# EAGLE board Adafruit Metro ESP32-P4 Hydra rev A (EAGLE 9.6.2)
REV: A
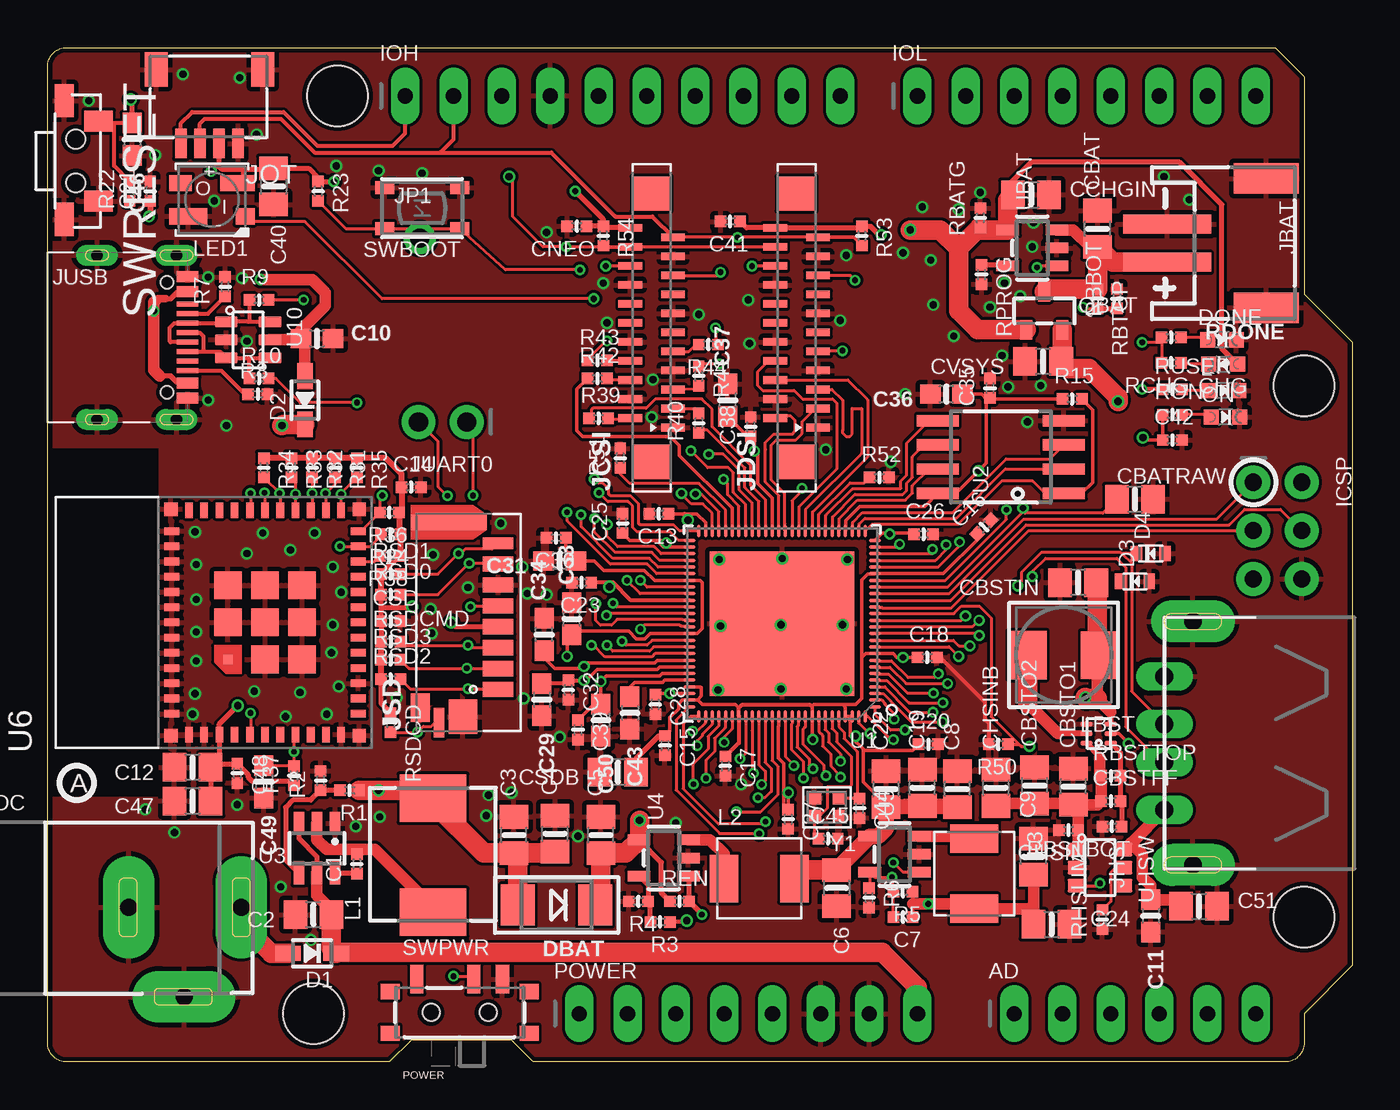
[diagram p3: board, top side]
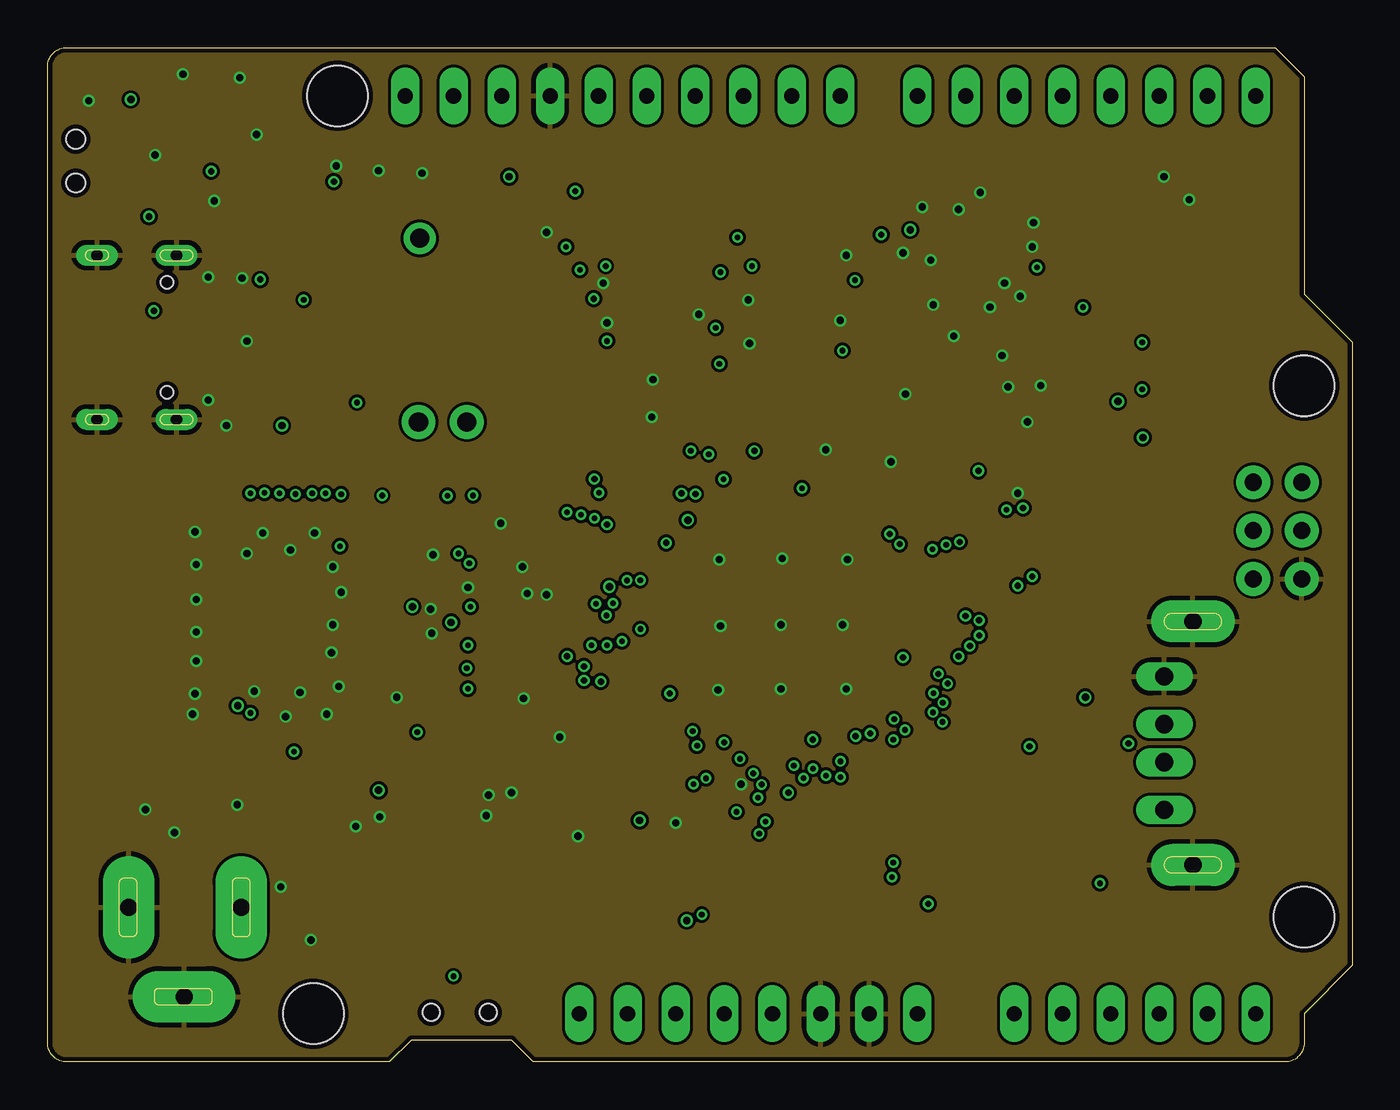
[diagram p4: board, inner layer Route2]
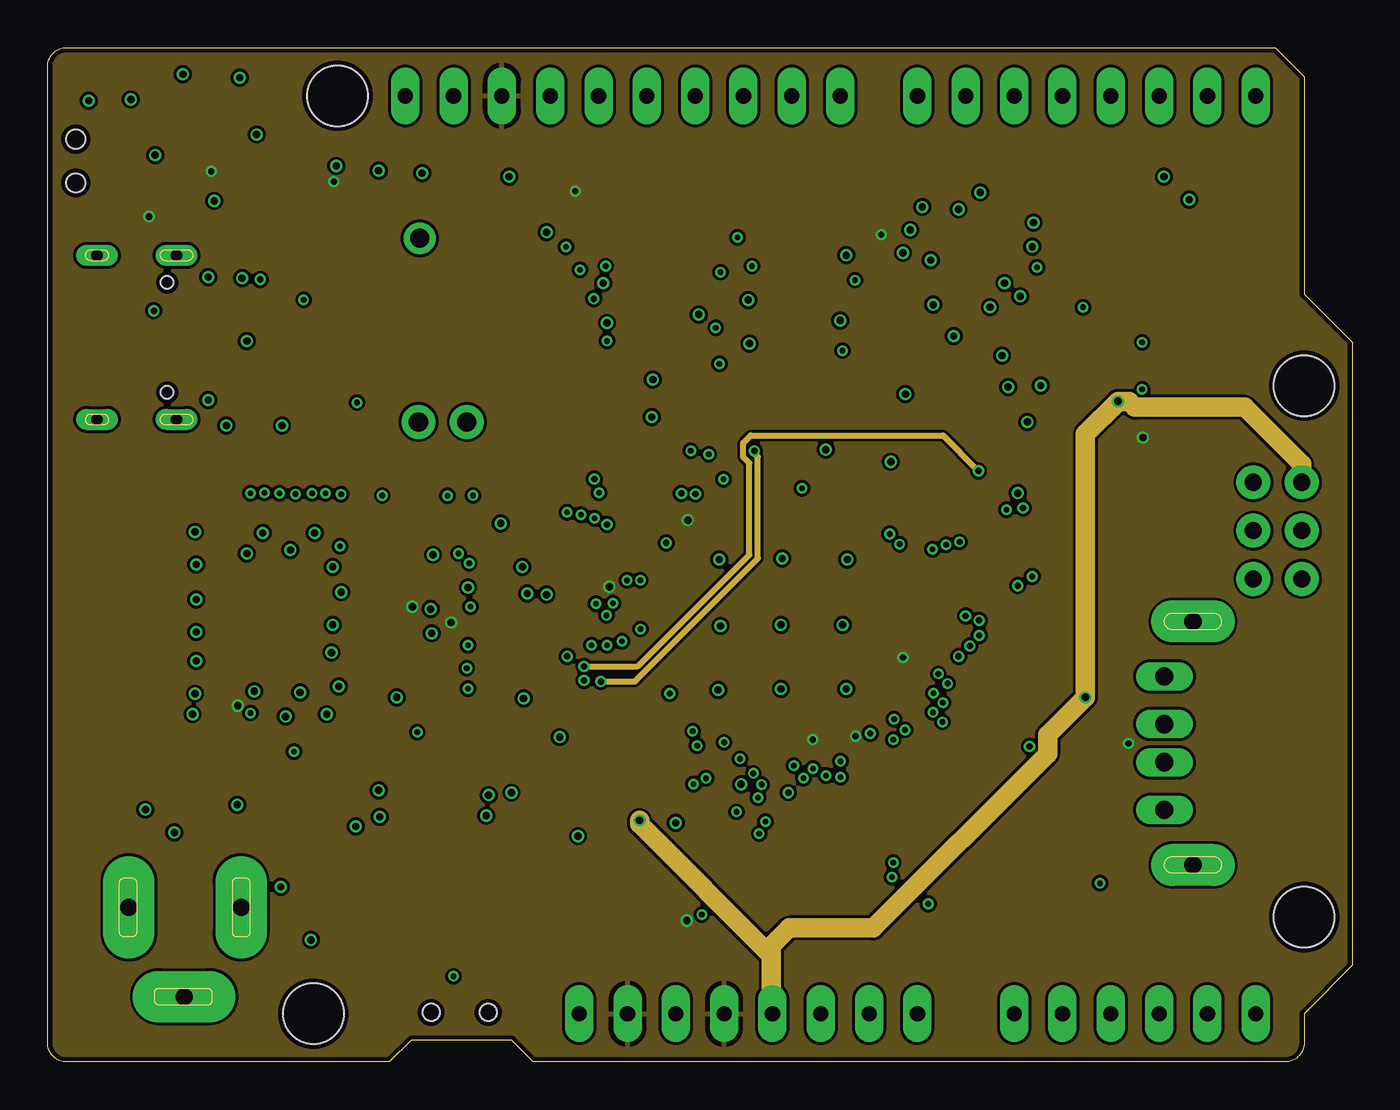
[diagram p5: board, inner layer Route15]
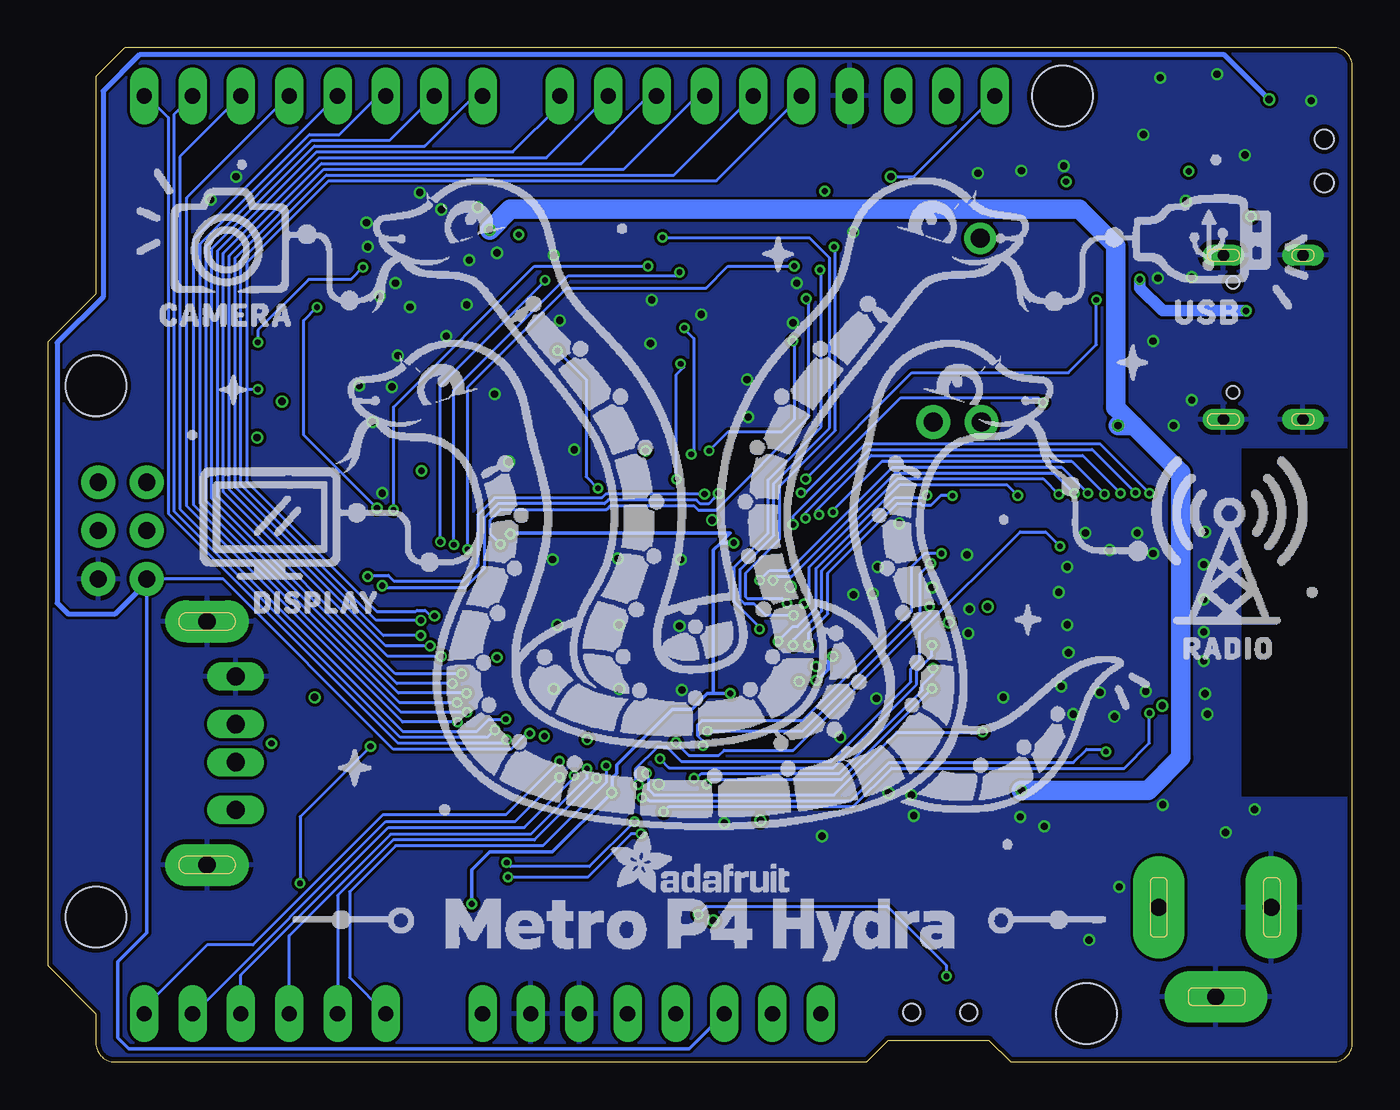
[diagram p6: board, bottom side, seen from below]

Size 68.58 x 53.34 mm. Coordinates in mm from the lower left corner, seen from the top.
Outline: 64.52,53.34 66.04,51.82 66.04,40.39 68.58,37.85 68.58,5.08 66.04,2.54 66.04,1 arc-90 65.04,0 25.53,0 24.38,1.14 19.11,1.14 17.97,0 1,0 arc-90 0,1 0,52.34 arc-90 1,53.34 64.52,53.34
Copper layers (1+2*15+16): Top 0.035mm / dielectric 1.5mm / Route2 0.035mm / dielectric 0.15mm / Route15 0.035mm / dielectric 0.2mm / Bottom 0.035mm
Design rules "adafruit 6-6 *": minimum track width 6mil, minimum drill 8mil, track to track 6mil, track to pad 6mil, pad to pad 6mil, via to via 6mil, smd to smd 6mil, copper to edge 10mil, drill to drill 8mil, minimum pad ring 10mil, minimum via ring 5mil, stop-mask expansion 2mil, vias tented up to drill 20mil, thermal gap 10mil
Net classes: 0 SIGNAL: width 0.152 mm, drill 0.203 mm, clearance 0.152 mm; 1 POWER: width 0.61 mm, drill 0.33 mm, clearance 0.152 mm; 2 HIGHPOWER: width 1.016 mm, drill 0.381 mm, clearance 0.152 mm; 3 FINEPOWER: width 0.191 mm, drill 0.33 mm, clearance 0.152 mm; 4 LOCALPOWER: width 0.305 mm, drill 0.33 mm, clearance 0.152 mm; 5 GROUND: width 0.203 mm, drill 0.33 mm, clearance 0.152 mm; 6 SWITCH: width 0.61 mm, drill 0.483 mm, clearance 0.152 mm
Holes 3.17 mm at 66.04,35.56 66.04,7.62 15.24,50.8 13.97,2.54
tRestrict: area 0,14 to 5.8,32.3
bRestrict: area 0,14 to 5.8,32.3
vRestrict: area 0,14 to 5.8,32.3

## Footprints (pad centres in the part's own frame; a part is rotated, then mirrored left to right if it is on the bottom)
1X06_OVALWAVE = drill 0.8 pad 1.5 long: 1 -6.35,0; 2 -3.81,0; 3 -1.27,0; 4 1.27,0; 5 3.81,0; 6 6.35,0
_0402NO = smd 0.6 x 0.6: 1 -0.508,0; 2 0.508,0
0805-NO = smd 1.24 x 1.5: 1 -0.95,0; 2 0.95,0
0603-NO = smd 1.075 x 1: 1 -0.85,0; 2 0.85,0
CHIPLED_0603_NOOUTLINE = smd 0.8 x 0.8: A 0,-0.75; C 0,0.75
SOD-323 = smd 1.35 x 0.8: A 1.27,0; C -1.27,0
SOD-523 = smd 0.8 x 0.6: A 0,-0.75; K 0,0.75
SMADIODE = smd 1.778 x 2.159: A 2.019,0; C -2.045,0
2X03_ROUND_70MIL = drill 0.9 pad 1.778: 1 -2.54,-1.27; 2 -2.54,1.27; 3 0,-1.27; 4 0,1.27; 5 2.54,-1.27; 6 2.54,1.27
1X10_OVALWAVE = drill 0.8 pad 1.5 long: 1 -11.43,0; 2 -8.89,0; 3 -6.35,0; 4 -3.81,0; 5 -1.27,0; 6 1.27,0; 7 3.81,0; 8 6.35,0; 9 8.89,0; 10 11.43,0
1X08_OVALWAVE = drill 0.8 pad 1.5 long: 1 -8.89,0; 2 -6.35,0; 3 -3.81,0; 4 -1.27,0; 5 1.27,0; 6 3.81,0; 7 6.35,0; 8 8.89,0
JSTPH2_BATT = smd 1 x 4.6: 1 -1,-2.303; 2 1,-2.303 | smd 1.6 x 3.4: NC1 -3.4,2.897; NC2 3.4,2.897
FPC_22PIN_0.5MM_VERT_F0503_ZV = smd 0.4 x 1.25: 1 -5.25,-1.125; 2 -4.75,1.125; 3 -4.25,-1.125; 4 -3.75,1.125; 5 -3.25,-1.125; 6 -2.75,1.125; 7 -2.25,-1.125; 8 -1.75,1.125; 9 -1.25,-1.125; 10 -0.75,1.125; 11 -0.25,-1.125; 12 0.25,1.125; 13 0.75,-1.125; 14 1.25,1.125; 15 1.75,-1.125; 16 2.25,1.125; 17 2.75,-1.125; 18 3.25,1.125; 19 3.75,-1.125; 20 4.25,1.125; 21 4.75,-1.125; 22 5.25,1.125 | smd 1.8 x 2: SUPPORT1 7.05,0; SUPPORT2 -7.05,0
DCJACK_2MM_PTH = drill 0.9 pad 2.7 long: GND -2.9,2.54; GNDBREAK 0,-2.16; PWR 3,2.54
USB_TYPE_A_THM_SHORT = drill 0.95 pad 1.5 long: D+ 1,1.5; D- -1,1.5; GND 3.5,1.5; VBUS -3.5,1.5 | drill 0.9 pad 2.2 long: S1 -6.4,0; S2 6.4,0
1X01_ROUND = drill 1 pad 1.676: 1 0,0
JST_SH4 = smd 0.6 x 1.55: 1 -1.5,2.006; 2 -0.5,2.006; 3 0.5,2.006; 4 1.5,2.006 | smd 1.2 x 1.8: MT1 -2.8,-1.894; MT2 2.8,-1.894
HANBO_TF_027_H375 = smd 0.8 x 1.6: 1 -3.53,-2.6; 2 -2.43,-2.6; 3 -1.33,-2.6; 4 -0.23,-2.6; 5 0.87,-2.6; 6 1.97,-2.6; 7 3.07,-2.6 | smd 0.6 x 1.6: 8 4.17,-2.6 | smd 1.56 x 0.55: CD -5.28,0.51 | smd 1.5 x 1: MT1 -4.48,1.5 | smd 1.8 x 1.5: MT2 -4.96,-0.74 | smd 0.8 x 4: MT3 5.27,0
1X02_ROUND = drill 1 pad 1.778: 1 -1.27,0; 2 1.27,0
USB_C_CUSB31-CFM2AX-01-X = smd 0.575 x 1.15: A1B12 -3.2,2.275; A4B9 -2.4,2.275; B1A12 3.2,2.275; B4A9 2.4,2.275 | smd 0.275 x 1.15: A5 -1.25,2.275; A6 -0.25,2.275; A7 0.25,2.275; A8 1.25,2.275; B5 1.75,2.275; B6 0.75,2.275; B7 -0.75,2.275; B8 -1.75,2.275 | drill 0.6 pad 1 long: M1 -4.32,1.7; M2 4.32,1.7; M3 -4.32,-2.48; M4 4.32,-2.48 | hole 0.65: 2.89,1.2; -2.89,1.2
INDUCTOR_0603S = smd 2.5 x 3.5: P$1 -3.05,0; P$2 2.95,0
INDUCTOR_SUNLORD_MWSA0402S = smd 1.5 x 2.5: P$1 -1.85,0; P$2 1.85,0
INDUCTOR_5045_SMALLTABS = smd 2 x 2.5: 1 -1.9,0 | smd 2 x 2.55: 2 1.9,0
LED3535_FULLPADS = smd 1 x 0.85: 1 -1.75,0.875 | smd 1.8 x 0.85: 2 -1.35,-0.875 | smd 1.2 x 0.85: 3 1.65,-0.875 | smd 2 x 0.85: 4 1.25,0.875
SOT23-R = smd 0.635 x 1.016: 1 -0.95,-1; 2 0.95,-1; 3 0,1
BTN_RKB2_4.6X2.8 = smd 1 x 0.7: A 1.973,1.075; A' -1.973,1.075; B 1.973,-1.075; B' -1.973,-1.075
SPDT_SMT_SSSS811101 = smd 0.7 x 1.5: A -2.25,1.242; B 0.75,1.242; C 2.25,1.242 | smd 1 x 0.8: SUP1 -3.65,0.592; SUP2 -3.65,-1.608; SUP3 3.65,0.592; SUP4 3.65,-1.608 | hole 0.9: -1.5,-0.508; 1.5,-0.508
SPST_TACTILE_RA = smd 1.1 x 1.5: 1 2.1,-0.9; 2 -2.1,-0.9 | smd 1.75 x 1: MT1 3.175,0.9; MT2 -3.075,0.9 | hole 1: 1.15,0.3; -1.15,0.3
QFN104_10X10_P035_EP76 = smd 0.65 x 0.19: 1 -4.875,4.375; 2 -4.875,4.025; 3 -4.875,3.675; 4 -4.875,3.325; 5 -4.875,2.975; 6 -4.875,2.625; 7 -4.875,2.275; 8 -4.875,1.925; 9 -4.875,1.575; 10 -4.875,1.225; 11 -4.875,0.875; 12 -4.875,0.525; 13 -4.875,0.175; 14 -4.875,-0.175; 15 -4.875,-0.525; 16 -4.875,-0.875; 17 -4.875,-1.225; 18 -4.875,-1.575; 19 -4.875,-1.925; 20 -4.875,-2.275; 21 -4.875,-2.625; 22 -4.875,-2.975; 23 -4.875,-3.325; 24 -4.875,-3.675; 25 -4.875,-4.025; 26 -4.875,-4.375; 53 4.875,-4.375; 54 4.875,-4.025; 55 4.875,-3.675; 56 4.875,-3.325; 57 4.875,-2.975; 58 4.875,-2.625; 59 4.875,-2.275; 60 4.875,-1.925; 61 4.875,-1.575; 62 4.875,-1.225; 63 4.875,-0.875; 64 4.875,-0.525; 65 4.875,-0.175; 66 4.875,0.175; 67 4.875,0.525; 68 4.875,0.875; 69 4.875,1.225; 70 4.875,1.575; 71 4.875,1.925; 72 4.875,2.275; 73 4.875,2.625; 74 4.875,2.975; 75 4.875,3.325; 76 4.875,3.675; 77 4.875,4.025; 78 4.875,4.375 | smd 0.19 x 0.65: 27 -4.375,-4.875; 28 -4.025,-4.875; 29 -3.675,-4.875; 30 -3.325,-4.875; 31 -2.975,-4.875; 32 -2.625,-4.875; 33 -2.275,-4.875; 34 -1.925,-4.875; 35 -1.575,-4.875; 36 -1.225,-4.875; 37 -0.875,-4.875; 38 -0.525,-4.875; 39 -0.175,-4.875; 40 0.175,-4.875; 41 0.525,-4.875; 42 0.875,-4.875; 43 1.225,-4.875; 44 1.575,-4.875; 45 1.925,-4.875; 46 2.275,-4.875; 47 2.625,-4.875; 48 2.975,-4.875; 49 3.325,-4.875; 50 3.675,-4.875; 51 4.025,-4.875; 52 4.375,-4.875; 79 4.375,4.875; 80 4.025,4.875; 81 3.675,4.875; 82 3.325,4.875; 83 2.975,4.875; 84 2.625,4.875; 85 2.275,4.875; 86 1.925,4.875; 87 1.575,4.875; 88 1.225,4.875; 89 0.875,4.875; 90 0.525,4.875; 91 0.175,4.875; 92 -0.175,4.875; 93 -0.525,4.875; 94 -0.875,4.875; 95 -1.225,4.875; 96 -1.575,4.875; 97 -1.925,4.875; 98 -2.275,4.875; 99 -2.625,4.875; 100 -2.975,4.875; 101 -3.325,4.875; 102 -3.675,4.875; 103 -4.025,4.875; 104 -4.375,4.875 | smd 7.6 x 7.6: 105 0,0
SOIC8_208MIL = smd 0.6 x 2.2: 1 -1.905,-3.315; 2 -0.635,-3.315; 3 0.635,-3.315; 4 1.905,-3.315; 5 1.905,3.315; 6 0.635,3.315; 7 -0.635,3.315; 8 -1.905,3.315
SOT23-6 = smd 0.55 x 1.2: 1 -0.95,-1.3; 2 0,-1.3; 3 0.95,-1.3; 4 0.95,1.3; 5 0,1.3; 6 -0.95,1.3
SOT23-5 = smd 0.55 x 1.2: 1 -0.95,-1.3; 2 0,-1.3; 3 0.95,-1.3; 4 0.95,1.3; 5 -0.95,1.3
ESP32-PICO-MINI = smd 0.8 x 0.4: 1 -5.9,4; 2 -5.9,3.2; 3 -5.9,2.4; 4 -5.9,1.6; 5 -5.9,0.8; 6 -5.9,0; 7 -5.9,-0.8; 8 -5.9,-1.6; 9 -5.9,-2.4; 10 -5.9,-3.2; 11 -5.9,-4; 25 5.9,-4; 26 5.9,-3.2; 27 5.9,-2.4; 28 5.9,-1.6; 29 5.9,-0.8; 30 5.9,0; 31 5.9,0.8; 32 5.9,1.6; 33 5.9,2.4; 34 5.9,3.2; 35 5.9,4 | smd 0.4 x 0.8: 12 -4.8,-4.9; 13 -4,-4.9; 14 -3.2,-4.9; 15 -2.4,-4.9; 16 -1.6,-4.9; 17 -0.8,-4.9; 18 0,-4.9; 19 0.8,-4.9; 20 1.6,-4.9; 21 2.4,-4.9; 22 3.2,-4.9; 23 4,-4.9; 24 4.8,-4.9; 36 4.8,4.9; 37 4,4.9; 38 3.2,4.9; 39 2.4,4.9; 40 1.6,4.9; 41 0.8,4.9; 42 0,4.9; 43 -0.8,4.9; 44 -1.6,4.9; 45 -2.4,4.9; 46 -3.2,4.9; 47 -4,4.9; 48 -4.8,4.9 | smd 1.45 x 1.45: 49 0,0; 54 -1.95,0; 55 -1.95,-1.95; 56 0,-1.95; 57 1.95,-1.95; 58 1.95,0; 59 1.95,1.95; 60 0,1.95 | smd 0.7 x 0.7: 50 5.95,4.95; 51 5.95,-4.95; 52 -5.95,-4.95; 53 -5.95,4.95 | smd 0.5 x 0.5: 61 -1.95,1.95
SOT23_6L_ST = smd 0.6 x 1.2: 1 -0.95,-1.15; 2 0,-1.15; 3 0.95,-1.15; 4 0.95,1.15; 5 0,1.15; 6 -0.95,1.15
SOT563 = smd 0.65 x 0.275: 1 -0.635,0.5; 2 -0.635,0; 3 -0.635,-0.5; 4 0.635,-0.5; 5 0.635,0; 6 0.635,0.5
SOT26_TYPE_A1_DIODES = smd 0.7 x 0.9: 1 -0.95,-1.25; 2 0,-1.25; 3 0.95,-1.25; 4 0.95,1.25; 5 0,1.25; 6 -0.95,1.25
CRYSTAL_2X1.6 = smd 0.75 x 0.7: 1 -0.675,-0.5; 2 0.675,-0.5; 3 0.675,0.5; 4 -0.675,0.5

## Placement (x,y rotation side)
AD  METRO ANALOG  [1X06_OVALWAVE]  57.15,2.54 0 top
C1  0.1uF  [_0402NO]  16.26,10.41 90 top
C2  10uF/25V  [0805-NO]  13.97,7.75 180 top
C3  22uF/10V  [0805-NO]  24.51,11.94 90 top
C4  22uF/10V  [0805-NO]  26.67,12 90 top
C5  10uF/10V  [0805-NO]  29.08,11.94 90 top
C6  22uF  [0805-NO]  41.47,9.14 270 top
C7  22pF  [_0402NO]  44.96,7.62 180 top
C8  10uF/10V  [0805-NO]  47.82,14.35 90 top
C9  22uF  [0805-NO]  51.82,10.79 90 top
C10  1uF  [0603-NO]  14.16,38.04 0 top
C11  1uF  [0603-NO]  57.98,7.68 270 top
C12  10uF/10V  [0805-NO]  7.62,15.49 180 top
C13  0.1uF  [_0402NO]  32.13,28.83 180 top
C14  0.1uF  [_0402NO]  19.11,30.23 0 top
C15  0.1uF  [_0402NO]  32.45,16.64 270 top
C16  0.1uF  [_0402NO]  49.21,28.13 45 top
C17  0.1uF  [_0402NO]  35.62,15.56 270 top
C18  0.1uF  [_0402NO]  46.23,21.27 0 top
C19  10uF/10V  [0805-NO]  45.97,14.41 90 top
C20  0.1uF  [_0402NO]  46.29,16.7 0 top
C21  0.1uF  [_0402NO]  5.4,45.78 90 top
C22  10uF/10V  [0805-NO]  44.07,14.35 90 top
C23  0.1uF  [_0402NO]  28.07,25.21 180 top
C24  10uF/10V  [0805-NO]  52.77,7.24 0 top
C25  0.1uF  [_0402NO]  30.23,28.32 90 top
C26  0.1uF  [_0402NO]  46.04,27.75 0 top
C27  0.1uF  [_0402NO]  38.93,12.76 270 top
C28  0.1uF  [_0402NO]  31.94,18.8 270 top
C29  1uF  [0603-NO]  25.97,19.05 270 top
C30  0.1uF  [_0402NO]  26.73,27.56 180 top
C31  1uF  [0603-NO]  26.92,26.35 180 top
C32  0.1uF  [_0402NO]  27.37,19.56 270 top
C33  1uF  [0603-NO]  27.56,23.3 90 top
C34  1uF  [0603-NO]  26.1,22.48 90 top
C35  0.1uF  [_0402NO]  49.53,35.43 90 top
C36  1uF  [0603-NO]  47.24,35.12 180 top
C37  1uF  [0603-NO]  35.75,34.8 90 top
C38  0.1uF  [_0402NO]  36.96,33.4 90 top
C39  10nF  [_0402NO]  27.88,17.46 270 top
C40  10uF/10V  [0805-NO]  11.87,46.04 270 top
C41  0.1uF  [_0402NO]  35.88,44.2 180 top
C42  10nF  [_0402NO]  59.12,32.7 0 top
C43  1uF  [0603-NO]  30.61,18.35 270 top
C44  15pF  [_0402NO]  42.67,13.34 270 top
C45  15pF  [_0402NO]  41.02,11.75 0 top
C46  1uF  [0603-NO]  4.45,48.51 270 top
C47  10uF/10V  [0805-NO]  7.62,13.72 180 top
C48  0.1uF  [_0402NO]  9.97,15.18 270 top
C49  1uF  [0603-NO]  11.37,14.73 270 top
C50  1uF  [0603-NO]  29.08,17.97 270 top
C51  10uF/10V  [0805-NO]  60.52,8.19 0 top
CBAT  10uF/10V  [0805-NO]  55.18,43.81 90 top
CBATRAW  2.2uF  [0805-NO]  57.15,29.59 0 top
CBSTFF  2.2nF/C0G  [_0402NO]  55.88,13.72 0 top
CBSTIN  22uF/10V  [0805-NO]  54.17,25.21 180 top
CBSTO1  22uF/10V  [0805-NO]  53.91,14.48 90 top
CBSTO2  22uF/10V  [0805-NO]  51.88,14.54 90 top
CCHGIN  10uF/10V  [0805-NO]  51.69,45.59 0 top
CHG  ORANGE  [CHIPLED_0603_NOOUTLINE]  61.79,36.7 90 top
CHSIN  0.1uF  [_0402NO]  53.66,12.19 180 top
CHSINB  10uF/10V  [0805-NO]  49.85,14.41 90 top
CNEO  0.1uF  [_0402NO]  27.81,43.94 180 top
CSD  0.1uF  [_0402NO]  18.03,23.18 0 top
CSDB  10uF/10V  [0805-NO]  29.97,15.24 180 top
CVSYS  10uF/10V  [0805-NO]  52.32,36.83 180 top
D1  PMEG2020  [SOD-323]  13.91,5.71 180 top
D2  PMEG2020  [SOD-323]  13.53,34.8 90 top
D3  TPD1E05U06  [SOD-523]  57.15,25.27 90 top
D4  TPD1E05U06  [SOD-523]  57.98,26.73 90 top
DBAT  B340A-13-F  [SMADIODE]  26.73,8.26 180 top
DONE  GREEN  [CHIPLED_0603_NOOUTLINE]  61.72,37.97 270 top
HYDRA_ART  METRO-P4-HYDRA  [METRO-P4-HYDRA-68.58X53.34]  68.56,0.02 0 bottom
ICSP  METRO SPI  [2X03_ROUND_70MIL]  64.64,27.94 270 top
IOH  METRO D8-D13 / I2C  [1X10_OVALWAVE]  30.23,50.8 0 top
IOL  METRO D0-D7  [1X08_OVALWAVE]  54.61,50.8 0 top
JBAT  JST PH BATTERY  [JSTPH2_BATT]  61.15,43.05 270 top
JCSI  CSI 22-PIN FPC  [FPC_22PIN_0.5MM_VERT_F0503_ZV]  31.75,38.61 90 top
JDC  7-12V DC  [DCJACK_2MM_PTH]  7.18,5.59 0 top
JDSI  DSI 22-PIN FPC  [FPC_22PIN_0.5MM_VERT_F0503_ZV]  39.37,38.61 90 top
JHS  AF 10.0 HC6.3  [USB_TYPE_A_THM_SHORT]  60.2,16.76 90 top
JP1  [1X01_ROUND]  19.56,43.31 0 top
JQT  STEMMA QT  [JST_SH4]  8.51,50.29 180 top
JSD  TF-027-H375  [HANBO_TF_027_H375]  21.08,23.11 90 top
JUART0  UART0  [1X02_ROUND]  20.76,33.66 180 top
JUSB  USB-C  [USB_C_CUSB31-CFM2AX-01-X]  5.08,38.1 270 top
L  RED  [CHIPLED_0603_NOOUTLINE]  61.85,35.31 270 top
L1  3.3uH/5A  [INDUCTOR_0603S]  20.26,10.92 90 top
L2  2.2uH  [INDUCTOR_SUNLORD_MWSA0402S]  37.4,9.65 0 top
L3  2.2uH  [INDUCTOR_SUNLORD_MWSA0402S]  48.7,9.91 270 top
LBST  1uH  [INDUCTOR_5045_SMALLTABS]  53.4,21.4 180 top
LED1  WS2812B_3535FULL  [LED3535_FULLPADS]  8.64,45.34 180 top
ON  GREEN  [CHIPLED_0603_NOOUTLINE]  61.91,33.91 270 top
PLABEL0  [PLABEL0]  56.9,33.91 0 top
PLABEL1  [PLABEL1]  57.28,35.43 0 top
PLABEL2  [PLABEL2]  27.94,5.46 90 top
PLABEL3  [PLABEL3]  30.73,5.71 90 top
PLABEL4  [PLABEL4]  33.02,5.71 90 top
PLABEL5  [PLABEL3]  35.56,5.71 90 top
PLABEL6  [PLABEL6]  38.1,5.71 90 top
PLABEL7  [PLABEL7]  40.64,5.97 90 top
PLABEL8  [PLABEL7]  43.18,5.97 90 top
PLABEL9  [PLABEL9]  45.72,5.71 90 top
PLABEL10  [PLABEL10]  18.03,48.13 0 top
PLABEL11  [PLABEL11]  21.34,48.13 0 top
PLABEL12  [PLABEL12]  23.88,47.24 90 top
PLABEL13  [PLABEL13]  26.42,46.61 90 top
PLABEL14  [PLABEL14]  28.96,48.26 0 top
PLABEL15  [PLABEL15]  31.5,48.26 0 top
PLABEL16  [PLABEL16]  34.04,48.26 0 top
PLABEL17  [PLABEL17]  50.8,48.26 0 top
PLABEL18  [PLABEL18]  53.34,48.26 0 top
PLABEL19  [PLABEL19]  55.88,48.26 0 top
PLABEL20  [PLABEL20]  58.42,48.26 0 top
PLABEL21  [PLABEL21]  50.8,5.08 0 top
PLABEL22  [PLABEL22]  53.34,5.08 0 top
PLABEL23  [PLABEL23]  55.88,5.08 0 top
PLABEL24  [PLABEL24]  58.42,5.08 0 top
PLABEL25  [PLABEL25]  60.96,5.08 0 top
PLABEL26  [PLABEL26]  63.5,5.08 0 top
PLABEL27  [PLABEL27]  60.45,30.48 0 top
PLABEL28  [PLABEL6]  67.82,31.24 90 top
PLABEL29  [PLABEL29]  60.33,28.07 0 top
PLABEL30  [PLABEL30]  67.82,27.94 90 top
PLABEL31  [PLABEL4]  60.58,25.4 0 top
PLABEL32  [PLABEL7]  67.82,24.89 90 top
PLABEL33  [PLABEL33]  63.31,32.51 0 top
PLABEL34  [PLABEL34]  28.26,40.32 90 top
PLABEL35  [PLABEL35]  42.04,32.13 90 top
PLABEL36  [PLABEL36]  29.46,45.47 0 top
PLABEL37  [PLABEL37]  41.97,37.72 90 top
PLABEL38  [PLABEL35]  34.1,31.94 90 top
PLABEL39  [PLABEL36]  36.58,45.53 0 top
PLABEL40  [PLABEL40]  36.58,48.26 0 top
PLABEL41  [PLABEL41]  39.12,48.26 0 top
PLABEL42  [PLABEL42]  41.66,48.26 0 top
PLABEL43  [PLABEL43]  45.72,48.26 0 top
PLABEL44  [PLABEL44]  48.26,48.26 0 top
PLABEL45  [PLABEL45]  60.96,48.26 0 top
PLABEL46  [PLABEL46]  63.5,48.26 0 top
PLABEL47  [PLABEL47]  23.94,33.66 0 top
PLABEL48  [PLABEL48]  17.65,33.59 0 top
PLABEL49  [PLABEL49]  56.45,36.7 0 top
PLABEL50  [PLABEL50]  56.01,38.1 0 top
PLABEL51  [PLABEL51]  20.76,31.88 0 top
PLABEL52  [PLABEL52]  16.38,45.09 90 top
PLABEL53  [PLABEL53]  2.54,52.32 0 top
PLABEL54  [PLABEL54]  22.29,16.13 0 top
PLABEL55  [PLABEL55]  5.33,30.73 0 top
PLABEL56  [PLABEL56]  5.97,1.14 0 top
PLABEL57  [PLABEL57]  10.16,42.42 0 top
PLABEL58  [PLABEL58]  19.75,40.07 0 top
PLABEL59  [PLABEL0]  16.76,2.67 90 top
PLABEL60  [PLABEL60]  26.54,2.67 90 top
PLABEL61  [PLABEL61]  50.16,28.7 0 top
PLABEL62  [PLABEL62]  49.78,17.91 0 top
PLABEL63  [PLABEL63]  12.7,50.55 90 top
PLABEL64  [PLABEL64]  21.72,5.84 0 top
PLABEL65  [PLABEL65]  23.24,36.26 0 top
POWER  METRO POWER  [1X08_OVALWAVE]  36.83,2.54 0 top
QBAT  DMP2045U-7  [SOT23-R]  52.39,39.5 0 top
R1  56K  [_0402NO]  15.88,14.29 180 top
R2  10K  [_0402NO]  14.35,14.8 90 top
R3  100K  [_0402NO]  32.19,7.37 180 top
R4  22.1K  [_0402NO]  31.05,8.45 180 top
R5  499K  [_0402NO]  44.96,8.95 180 top
R6  499K  [_0402NO]  43.18,8.64 270 top
R7  5.1K  [_0402NO]  9.33,40.77 90 top
R8  5.1K  [_0402NO]  11.05,35.12 0 top
R9  22R  [_0402NO]  11.11,40.07 0 top
R10  22R  [_0402NO]  11.11,35.94 0 top
R15  10K  [_0402NO]  53.85,34.86 0 top
R22  10K  [_0402NO]  4.32,45.78 90 top
R23  10K  [_0402NO]  14.22,45.78 270 top
R24  10K  [_0402NO]  18.03,27.75 180 top
R31  10K  [_0402NO]  15.11,31.24 270 top
R32  10K  [_0402NO]  13.91,31.24 270 top
R33  10K  [_0402NO]  12.83,31.24 270 top
R34  10K  [_0402NO]  11.37,31.24 270 top
R35  10K  [_0402NO]  16.26,31.24 270 top
R36  10K  [_0402NO]  17.97,28.89 180 top
R37  10K  [_0402NO]  12.95,15.05 90 top
R38  10K  [_0402NO]  17.97,26.61 180 top
R39  100R  [_0402NO]  28.96,33.85 0 top
R40  100R  [_0402NO]  34.23,33.59 90 top
R41  100R  [_0402NO]  34.23,36.07 270 top
R42  100R  [_0402NO]  28.89,35.94 0 top
R43  100R  [_0402NO]  28.89,36.89 0 top
R44  100R  [_0402NO]  34.73,37.72 180 top
R50  10K  [_0402NO]  49.97,16.7 180 top
R51  4.02K 1%  [_0402NO]  30.1,31.75 90 top
R52  4.02K 1%  [_0402NO]  43.71,30.73 0 top
R53  2.2K  [_0402NO]  42.8,43.43 270 top
R54  2.2K  [_0402NO]  29.21,43.43 270 top
RBATG  100K  [_0402NO]  49.02,44.39 90 top
RBBOT  1M  [_0402NO]  56.2,40.13 90 top
RBSTBOT  10K  [_0402NO]  55.94,12.38 180 top
RBSTTOP  75K  [_0402NO]  55.88,15.05 0 top
RBTOP  1M  [_0402NO]  55.18,40.13 270 top
RCHG  5.1K  [_0402NO]  59.05,36.77 180 top
RDONE  22.1k  [_0402NO]  59.05,38.1 0 top
REN  100K  [_0402NO]  33.21,8.45 0 top
RHSLIM  42.2K 1%  [_0402NO]  55.44,7.49 90 top
RON  22.1k  [_0402NO]  59.12,34.04 0 top
RPROG  2.2K  [_0402NO]  49.09,41.4 270 top
RSD0  10K  [_0402NO]  18.03,24.57 0 top
RSD1  10K  [_0402NO]  18.03,25.65 0 top
RSD2  10K  [_0402NO]  18.03,20.13 0 top
RSD3  10K  [_0402NO]  18.03,21.15 0 top
RSDCD  10K  [_0402NO]  18.03,17.84 270 top
RSDCMD  10K  [_0402NO]  18.03,22.1 0 top
RUSER  5.1K  [_0402NO]  59.12,35.37 0 top
SWBOOT  BOOT  [BTN_RKB2_4.6X2.8]  19.68,44.89 180 top
SWPWR  POWER  [SPDT_SMT_SSSS811101]  21.65,3.11 0 top
SWRESET  RESET  [SPST_TACTILE_RA]  1.78,47.37 90 top
U1  ESP32-P4NRW32X  [QFN104_10X10_P035_EP76]  38.61,23.05 180 top
U2  GD25Q128ESIG  [SOIC8_208MIL]  50.1,31.81 90 top
U3  TPS563201  [SOT23-6]  14.16,11.24 180 top
U4  TLV62569  [SOT23-5]  32.38,10.73 90 top
U5  TLV62569  [SOT23-5]  44.51,10.92 90 top
U6  ESP32-C6-MINI-1-N4  [ESP32-PICO-MINI]  11.43,23.11 90 top
U10  USBLC6-2SC6  [SOT23_6L_ST]  10.54,37.97 270 top
U$1  [PCBFEAT-REV-040]  1.52,14.67 0 top
UBAT  MCP73831T-2ACI/OT  [SOT23-5]  51.75,42.8 90 top
UBST  TPS61023  [SOT563]  55.24,17.27 180 top
UHSW  AP22653W6-7  [SOT26_TYPE_A1_DIODES]  55.31,10.22 270 top
Y1  40MHz 10pF 10ppm  [CRYSTAL_2X1.6]  40.96,13.4 180 top

## Tracks (layer width: path | path; a pad name or v marks a point on that pad's centre or on a via)
1.2V  (via drill 0.33)
  Top 0.191: U1.26 43.87,27.81 44.31,27.81 | C26.1 45.47,27.81 44.31,27.81 | U1.54 32.36,27.08 32.01,27.43 | 32.01,27.43 30.61,27.43 C25.1 | C28.1 32.01,19.38 v32.7,19.38 U1.76 | C7.1 45.47,8.32 R5.1 | U1.91 38.43,17.67 38.41,17.64 38.41,15.99 38.69,15.7 38.69,13.5 C27.1 38.92,14.15 v38.94,14.16 | v32.51,27.3 32.38,27.43 32.01,27.43 | v44.26,27.76 44.31,27.81
  Top 0.61: 45.47,8.32 v46.29,8.32 48.44,8.32 L3.P$2 51.62,8.06 51.82,8.26 | C24.1 51.82,8.26 | 51.82,8.26 C9.1
  Bottom 0.191: v46.29,8.32 46.29,10.1 45.34,11.04 42.06,11.04 v38.94,14.16 38.9,14.2 38.9,14.95 38.67,15.18 38.67,15.62 35.75,18.54 34.73,18.54 33.9,19.38 33.53,19.38 | v32.7,19.38 33.53,19.38 | v44.26,27.76 44.21,27.8 32.7,27.8 33.21,27.3 | v32.51,27.3 33.21,27.3 | 33.21,27.3 33.59,26.91 33.59,19.44 33.53,19.38
2.5V  (via drill 0.33)
  Top 0.191: U1.41 38.09,28.3 38.1,28.31 38.1,29.65 37.34,30.42 37.34,31.94 v37.15,32.13 37.15,32.7 C38.1 36.81,32.89 C37.1 | U1.73 | U1.73 32.31,20.43 32.19,20.3 29.37,20.3 v29.08,20.01 v29.08,20 C50.1 28.73,18.82 C39.1
  Route15 0.305: v29.08,20 30.86,20 37.34,26.48 37.34,31.81 37.02,32.13 v37.15,32.13
3.3V  (via drill 0.33, 0.35, 0.38)
  Top 0.191: C16.1 48.85,27.74 48.93,27.53 47.08,25.68 U1.21 43.48,25.67 43.11,25.67 42.8,25.36 42.8,21.27 | U1.51 34.58,28.36 34.12,28.82 33.47,28.82 C13.1 | U1.75 34.31,19.73 34.35,19.68 34.35,19.24 34.16,19.05 | 34.16,19.05 34.14,19.03 U1.77 33.37,19.03 33.16,18.82 33.16,18.56 32.71,18.11 32.71,17.41 C15.1 | 29.34,25.21 29.34,25.18 v29.53,24.99 | RON.1 C42.1 57.7,32.7 v57.57,32.83 | U1.101 U1.102 | U1.101 42.19,17.92 42.19,17.14 42.33,16.99 | C22.1 44.07,13.53 42.87,14.73 42.87,16.38 | 42.33,16.99 42.87,16.45 42.87,16.38 | v40.22,16.95 40.19,16.98 40.19,18.17 U1.96 40.18,18.67 40.18,18.72 40.26,18.8 41.78,18.8 | U1.101 41.93,18.65 41.78,18.8 | 41.78,18.8 42.48,18.8 42.8,19.11 42.8,21.27 | 42.8,21.27 43,21.48 U1.9 43.49,21.47 44.44,21.47 44.64,21.27 v44.96,21.27 C18.1 | UBST.2 56.29,17.27 v56.81,16.75 | 34.16,19.05 34.42,18.8 36.15,18.8 36.33,18.62 | 42.33,16.99 v42.47,17.13 | C20.1 45.47,16.38 42.87,16.38
  Top 0.203: U1.62 30.65,24.28 29.72,25.21 29.34,25.21 C23.1 | 33.47,28.82 33.47,28.68 v33.66,28.49 | v33.6,7.44 33.53,7.37 R3.1 | C17.1 36.33,16.77 U1.85 36.33,18.62 36.51,18.8 40.06,18.8 40.18,18.67
  Top 0.254: R38.1 RSD1.1 | RSDCMD.1 CSD.1 17.53,23.88 | RSDCD.1 17.53,18.86 RSD2.1 | JSD.4 21.44,22.88 v21.21,23.11 | 17.53,23.88 19.11,23.88 v19.18,23.94 | C12.1 9.03,15.95 U6.3 9.03,17.77 v9.99,18.73 | C12.1 8.76,15.68 C48.1 9.97,15.66 10.55,15.08 10.55,14.97 10.75,14.77 12.73,14.77 R37.1 | C12.1 C47.1 | C15.1 32.13,17.14 30.92,15.94 CSDB.1 | C21.1 R22.1 | JQT.2 9.01,47.24 | 9.01,47.24 9.01,47.11 9.19,46.93 10.29,46.93 | 10.29,46.93 11.81,46.93 C40.1 13.72,46.99 14.22,46.48 R23.1 v15.05,46.29 | 9.01,47.24 v8.6,46.83 | C41.1 36.72,43.86 JDSI.22 42.72,43.86 R53.1 43.24,43.94 43.69,43.5 v43.81,43.5 | JCSI.22 29.29,43.86 R54.1 | R54.1 CNEO.1 | R54.1 29.21,44.31 v27.74,45.78 | 17.53,23.88 RSD0.1 | 10.29,46.93 10.29,46.29 10.21,46.21 LED1.2
  Top 0.305: R38.1 18.54,26.67 R24.1 18.48,27.81 R36.1 18.61,29.02 C14.1 18.61,30.92 17.78,31.75 R35.1 R31.1 R32.1 R33.1 R34.1 | RSD2.1 RSD3.1 RSDCMD.1 | RSD1.1 RSD0.1 | 5.33,45.21 C21.1 5.4,44.51 v5.33,44.45
  Top 0.813: C6.1 41.47,10.12 U5.4 43.66,11.87 44.07,12.28 C22.1 44.2,13.4 45.09,13.43 | C19.1 45.09,13.43 | 45.09,13.43 47.78,13.43 C8.1
  Top 1.016: C6.1 39.69,10.09 L2.P$2
  pour Route15: 0,0 68.58,0 68.58,53.34 0,53.34
5.0V  (via drill 0.38)
  Top 0.254: CHG.A 61.72,37.52 61.72,45.09 59.5,47.31 51.69,47.31 50.61,46.23 50.61,45.72 CCHGIN.1
  Top 1.016: C3.1 22.92,10.99 20.26,13.65 L1.P$2 19.84,14.29 v17.4,14.29 R1.1 | C3.1 26.61,10.99 C4.1 | DBAT.A 24.71,10.79 C3.1 | CCHGIN.1 50.45,45.31 UBAT.4 49.15,43.75 RBATG.1 48.96,43.88 47.88,42.8 | QBAT.1 48.88,38.5 47.88,39.5 47.88,42.8 | D2.C 12.38,33.53 v12.32,33.47 | 47.88,42.8 46.93,43.75 v45.34,43.75
  Bottom 1.016: v17.4,14.29 10.73,14.29 9.02,16 9.02,30.99 11.49,33.47 | 11.49,33.47 12.45,34.42 12.45,42.93 14.35,44.83 44.26,44.83 v45.34,43.75 | v12.32,33.47 11.49,33.47
A0  (via drill 0.3)
  Top 0.152: U1.92 38.78,16.07 39.22,15.63 v39.22,15.59
  Bottom 0.152: v39.22,15.59 39.22,14.69 42.55,11.37 50.29,11.37 52.7,8.95 52.7,4.45 AD.1
A1  (via drill 0.3)
  Top 0.152: U1.93 39.13,17.8 39.09,17.75 39.09,16.43 39.72,15.8 v39.72,14.92
  Bottom 0.152: AD.2 53.34,8.75 50.42,11.67 42.99,11.67 39.74,14.92 v39.72,14.92
A2  (via drill 0.3)
  Top 0.152: U1.94 39.46,18.15 39.46,17.69 39.39,17.63 39.39,16.56 40.03,15.92 40.03,15.62 v40.23,15.42
  Bottom 0.152: v40.23,15.42 40.23,14.93 43.18,11.98 50.55,11.98 55.88,6.64 AD.3
A3  (via drill 0.3)
  Top 0.152: U1.95 39.83,17.61 39.7,17.47 39.7,16.72 40.79,15.63 40.79,15.18 v40.91,15.05
  Bottom 0.152: v40.91,15.05 40.91,14.93 43.52,12.32 50.67,12.32 58.42,4.57 AD.4
A4  (via drill 0.3)
  Top 0.152: v41.67,14.98 41.67,15.05 41.16,15.55 41.16,16.19 40.74,16.61 40.74,17.17 40.54,17.37 40.54,18.13 40.56,18.15 U1.97
  Bottom 0.152: AD.5 60.91,2.54 50.8,12.65 44.01,12.65 v41.67,14.98
A5  (via drill 0.3)
  Top 0.152: U1.98 40.86,18.16 40.86,17.48 41.04,17.3 41.04,16.83 41.68,16.19 v41.68,15.81
  Bottom 0.152: v41.68,15.81 44.47,13.02 50.93,13.02 57.78,6.16 60.2,6.16 63.5,2.86 AD.6
BAT_LED
  Top 0.152: CHG.C 59.63,36.7 RCHG.1
BAT_PROG
  Top 0.254: UBAT.5 50.39,41.91 RPROG.1
BAT_SENSE  (via drill 0.3, 0.33)
  Top 0.152: U1.19 47.3,24.98 51.27,28.94 | 51.27,28.94 v51.27,29.12 | v54.42,39.69 54.48,39.62 RBTOP.2 | CBATRAW.1 55.46,28.85 51.36,28.85 51.27,28.94
  Top 0.254: RBTOP.2 RBBOT.1
  Bottom 0.152: v51.27,29.12 55.12,32.97 55.12,38.99 v54.42,39.69
BAT_STAT  (via drill 0.3)
  Top 0.152: RDONE.1 58.55,37.85 | 58.55,37.85 RCHG.2 | UBAT.1 52.07,41.85 v52.01,41.78 | v57.53,37.85 58.55,37.85
  Bottom 0.152: v52.01,41.78 52.64,41.15 54.86,41.15 57.53,38.48 v57.53,37.85
BOOT  (via drill 0.3)
  Top 0.152: R23.2 15.68,43.82 SWBOOT.A 19.56,43.82 | 19.56,43.82 SWBOOT.A' 24.06,41.66 v27.99,41.66 | U1.66 33.71,22.9 33.29,22.9 33.22,22.97 31.36,22.97 v31.16,22.77 | JP1.1 19.56,43.82
  Bottom 0.152: v31.16,22.77 31.16,22.87 32.49,24.2 32.49,26.03 30.71,27.81 30.71,30.61 27.93,33.39 27.93,41.59 v27.99,41.66
BST_FB
  Top 0.254: RBSTBOT.1 56.45,13.65 CBSTFF.2 RBSTTOP.2 56.39,16.26 UBST.1
BST_SW
  Top 0.305: UBST.5 53.09,17.27
  Top 0.61: 53.09,17.27 51.5,18.86
  Top 1.016: 51.5,18.86 LBST.2
BUCK5_BST
  Top 0.254: C1.1 15.14,9.91 U3.6
BUCK5_FB
  Top 0.191: U3.4 13.04,10.11
  Top 0.254: R1.2 R2.1 13.84,13.78 12.89,13.78 12.51,13.4 12.51,10.64 13.04,10.11
BUCK5_SW
  Top 0.61: U3.2 14.16,11.68 14.67,11.18 16.32,11.18 | L1.P$1 20.26,8.13 17.21,11.18 16.32,11.18 | 16.32,11.18 16.32,10.99 C1.2
C6_EN  (via drill 0.3)
  Top 0.152: U1.89 37.72,18.16 37.72,15.76 38.04,15.44 38.04,14.23 37.72,13.91 v37.34,13.91 | U6.8 12.95,17.14 v12.95,16.32 R37.2 12.93,15.58 C49.1
  Bottom 0.152: v37.34,13.91 37.12,13.91 36.95,13.74 26.36,13.74 24.35,15.75 14.67,15.75 13.97,16.45 13.08,16.45 v12.95,16.32
C6_WAKE  (via drill 0.3)
  Top 0.152: U1.90 38.08,15.85 38.37,15.56 38.37,14.04 37.48,13.15 v36.21,13.15 | v10.67,18.35 10.67,17.25 U6.5
  Bottom 0.152: v36.21,13.15 35.93,13.43 26.23,13.43 24.22,15.44 11.99,15.44 10.67,16.76 v10.67,18.35
C6BOOT  (via drill 0.3)
  Top 0.152: R24.2 17.53,27.68 16.96,27.11 U6.23 v15.37,27.11 | U1.88 37.38,15.63 37.72,15.29 37.72,14.78 v37.53,14.59
  Bottom 0.152: v37.53,14.59 37.66,14.72 37.66,15.43 36.51,16.57 36.04,16.57 35.28,15.81 27.39,15.81 23.21,19.99 23.21,20.67 22.73,21.15 22.73,22.61 17.46,27.88 16.13,27.88 v15.37,27.11
C6IO8
  Top 0.152: U6.22 17.17,26.31 R38.2
C6RX  (via drill 0.3)
  Top 0.152: U1.56 32.17,26.38 31.76,26.79 29.83,26.79 28.74,27.88 v28.74,28.58 | v11.41,29.93 11.41,29.04 U6.30
  Bottom 0.152: v28.74,28.58 28.77,28.61 28.77,28.84 25.4,32.21 13.68,32.21 v11.41,29.93
C6TX  (via drill 0.3, 0.33)
  Top 0.152: U1.55 32.25,26.73 31.88,27.09 29.96,27.09 29.4,27.65 v29.4,28.26 | v10.67,29.91 10.67,29.05 U6.31
  Bottom 0.152: v10.67,29.91 13.27,32.51 25.59,32.51 29.4,28.7 v29.4,28.26
CAM_IO0  (via drill 0.3)
  Top 0.152: U1.23 46.67,26.38 47.23,26.94 v47.23,27.19 | JCSI.17 35.2,41.36 v35.37,41.53
  Bottom 0.152: v47.23,27.19 47.23,35.32 41.21,41.34 35.56,41.34 v35.37,41.53
CAM_IO1  (via drill 0.3)
  Top 0.152: U1.24 46.51,26.73 v46.51,26.96 | JCSI.18 30.61,41.85 v29.34,41.85
  Bottom 0.152: v46.51,26.96 46.51,35.48 41.29,40.7 33.97,40.7 32.83,41.85 v29.34,41.85
CORE_EN  (via drill 0.3)
  Top 0.152: U1.79 33.79,18.18 33.4,17.79 33.4,14.37 35.25,12.52 37.6,12.52 v37.73,12.64 | U5.1 44.96,9.97 v44.45,10.48
  Bottom 0.152: v44.45,10.48 44.24,10.27 40.1,10.27 v37.73,12.64
CORE_FB  (via drill 0.3)
  Top 0.152: v37.4,12 35.31,12 35.32,12.01 33.03,14.29 33.03,17.98 U1.78 | R6.1 43.21,9.18 U5.5 43.47,9.72 v44.39,9.72 44.39,9.02 R5.2 C7.2
  Bottom 0.152: v37.4,12 37.91,12 40.2,9.72 v44.39,9.72
CSI_CK_C_N
  Top 0.152: R43.2 30.14,36.89 30.58,36.91 JCSI.8
CSI_CK_C_P
  Top 0.152: R44.2 34.06,37.72 33.7,37.36 JCSI.9
CSI_CK_N  (via drill 0.3)
  Top 0.152: U1.45 36.68,29.31 36.04,29.95 36.04,30.99 35.78,31.25 34.7,31.25 v33.81,32.14 | v29.4,37.91 29.34,37.91 28.38,36.96 R43.1
  Bottom 0.152: v33.81,32.14 32.8,33.15 29.97,33.15 29.34,33.78 29.34,37.85 v29.4,37.91
CSI_CK_P  (via drill 0.3)
  Top 0.152: U1.44 37.03,29.39 36.35,30.08 36.35,31.12 35.51,31.96 v34.75,31.96 | v35.12,38.61 35.12,37.85 R44.1
  Bottom 0.152: v34.75,31.96 34.61,32.1 34.61,38.04 35.12,38.54 v35.12,38.61
CSI_D0_C_N
  Top 0.152: JCSI.2 30.55,33.78 29.53,33.78 R39.2
CSI_D0_C_P
  Top 0.152: JCSI.3 34.02,34.36 34.23,34.15 R40.2
CSI_D0_N
  Top 0.152: U1.42 37.73,29.56 36.96,30.33 36.96,31.37 34.92,33.4 34.92,34.32 34.39,34.86 31.94,34.86 31.45,34.37 28.66,34.37 28.57,34.29 28.57,33.97 R39.1
CSI_D0_P
  Top 0.152: U1.43 37.38,29.48 36.65,30.2 36.65,31.24 34.67,33.23 34.37,33.23 R40.1
CSI_D1_C_N
  Top 0.152: R41.2 34.23,35.44 34.16,35.37 JCSI.5
CSI_D1_C_P
  Top 0.152: JCSI.6 29.48,35.86 R42.2
CSI_D1_N  (via drill 0.3)
  Top 0.152: U1.46 36.33,29.23 35.74,29.83 35.74,30.43 v35.53,30.64 | v35.31,36.7 34.52,36.7 | 34.52,36.7 | 34.52,36.7 34.35,36.7 R41.1
  Bottom 0.152: v35.53,30.64 35.53,36.15 35.14,36.54 v35.31,36.7
CSI_D1_P
  Top 0.191: U1.47 35.98,29.12 33.21,31.9 33.21,32.41 32.73,32.89 28.13,32.89 27.81,33.21 27.81,35.37 R42.1
CSI_EXT
  Top 0.152: U1.48 35.63,29.02 34.23,30.42 30.61,30.42 30.1,30.92 R51.1
D2  (via drill 0.3)
  Top 0.152: U1.2 43.84,19.03 44.01,18.86 44.01,18.84 44.04,18.81 44.04,18.77 44.49,18.31 v44.49,18.02
  Bottom 0.152: IOL.6 61.62,47.6 61.62,29.08 49.91,17.37 46.03,17.37 45.38,18.02 v44.49,18.02
D3  (via drill 0.3)
  Top 0.152: U1.3 43.92,19.38 44.31,18.99 44.31,18.97 45.4,17.88 v47.04,17.88
  Bottom 0.152: v47.04,17.88 49.92,17.88 61.27,29.22 61.27,45.44 55.91,50.8 IOL.5
D4  (via drill 0.3)
  Top 0.152: U1.4 44,19.73 44.62,19.11 44.62,19.09 45.32,18.39 v46.54,18.39
  Bottom 0.152: v46.54,18.39 50,18.39 60.91,29.3 60.91,43.26 53.37,50.8 IOL.4
D5  (via drill 0.3)
  Top 0.152: U1.5 43.51,20.05 44.11,20.05 45.27,18.89 v47.05,18.89
  Bottom 0.152: v47.05,18.89 50.07,18.89 60.55,29.37 60.55,43.03 54.81,48.77 53.24,48.77 51.21,50.8 IOL.3
D6  (via drill 0.3)
  Top 0.152: U1.6 43.51,20.4 44.19,20.4 45.19,19.4 v46.56,19.4
  Bottom 0.152: v46.56,19.4 50.15,19.4 60.25,29.5 60.25,42.9 54.69,48.46 50.6,48.46 IOL.2
D7  (via drill 0.3)
  Top 0.152: U1.7 43.51,20.75 44.27,20.75 45.12,19.9 v47.31,19.9
  Bottom 0.152: v47.31,19.9 50.22,19.9 59.94,29.62 59.94,42.77 54.56,48.16 48.77,48.16 46.13,50.8 IOL.1
D8  (via drill 0.3)
  Top 0.152: U1.8 43.51,21.1 44.35,21.1 45.23,20.22 46.62,20.22 v46.81,20.41
  Bottom 0.152: v46.81,20.41 50.3,20.41 59.64,29.75 59.64,42.65 54.44,47.85 44.12,47.85 41.66,50.32 IOH.10
D9  (via drill 0.33)
  Top 0.152: U1.10 47.39,21.83 v47.88,21.33
  Bottom 0.152: v47.88,21.33 50.7,21.33 59.34,29.97 59.34,42.52 54.31,47.55 42.37,47.55 IOH.9
D10  (via drill 0.33)
  Top 0.152: U1.11 47.61,22.18 47.9,21.88 v48.47,21.88
  Bottom 0.152: v48.47,21.88 50.81,21.88 59.03,30.1 59.03,42.4 54.18,47.24 40.54,47.24 36.98,50.8 IOH.8
D11  (via drill 0.33)
  Top 0.152: v48.97,22.43 48.87,22.53 U1.12
  Bottom 0.152: v48.97,22.43 50.93,22.43 58.73,30.23 58.73,42.27 54.06,46.94 38.3,46.94 34.44,50.8 IOH.7
D12  (via drill 0.33)
  Top 0.152: v48.96,23.23 48.61,22.88 U1.13
  Bottom 0.152: v48.96,23.23 51.29,23.23 58.42,30.35 58.42,42.14 53.93,46.63 35.66,46.63 IOH.6
D13  (via drill 0.3, 0.33)
  Top 0.152: U1.14 48.03,23.23 v48.25,23.44 v48.25,23.45
  Top 0.203: RUSER.1 v57.53,35.37
  Bottom 0.152: IOH.5 33.43,46.33 53.8,46.33 58.12,42.02 58.12,35.43 | 58.12,35.43 58.12,30.53 51.27,23.69 49.23,23.69 49.17,23.75 48.74,23.75 48.45,23.45 v48.25,23.45 | 58.12,35.43 58.05,35.37 v57.53,35.37
DONE_LED
  Top 0.152: DONE.A 60.84,38.1 RDONE.2
DSI_CK_N
  Top 0.152: U1.37 39.48,29.18 41.47,31.17 41.47,34.66 41.27,34.86 39.69,34.86 39.24,35.31 37.59,35.31 37.33,35.56 37.33,36.31 37.87,36.86 JDSI.8
DSI_CK_P  (via drill 0.3)
  Top 0.152: U1.38 39.13,29.51 39.66,30.04 v39.66,30.16 | JDSI.9 41.1,37.36 41.15,37.4 v41.78,37.4
  Bottom 0.152: v39.66,30.16 40.27,30.78 40.27,35.89 v41.78,37.4
DSI_D0_N
  Top 0.152: U1.40 38.43,29.77 38.42,29.77 38.42,29.79 37.73,30.49 37.73,32.2 37.73,32.21 37.73,32.57 38.15,32.99 39.1,32.99 39.27,33.16 39.27,33.75 39.05,33.97 38.24,33.97 JDSI.2
DSI_D0_P
  Top 0.152: U1.39 38.76,27.95 38.76,28.29 38.74,28.31 38.74,29.89 38.73,29.9 38.73,29.91 38.04,30.61 38.04,32.45 38.27,32.69 39.29,32.69 39.65,33.05 39.64,33.06 39.64,33.65 40.35,34.36 JDSI.3
DSI_D1_N
  Top 0.152: U1.36 39.83,29.04 42.79,32 42.79,34.36 42.29,34.36 42.29,33.02 42.16,32.89 41.97,32.89 41.77,33.08 41.77,33.2 41.78,33.21 41.78,34.8 41.22,35.36 JDSI.5
DSI_D1_P
  Top 0.152: U1.35 40.21,27.95 40.21,28.93 43.1,31.81 43.1,34.82 42.06,35.86 JDSI.6
DSI_EXT
  Top 0.152: R52.1 42.92,30.45 42.18,30.45 40.53,28.8 U1.34
F_CLK
  Top 0.152: U1.32 41.26,27.95 41.26,28.67 42.43,29.84 44.96,29.84 45.15,30.04 45.15,30.43 45.46,30.73 45.46,31.83 46.08,32.45 U2.6
F_CS
  Top 0.152: U1.27 43.34,28.28 47.87,28.28 50.14,30.54 51.77,30.54 52.4,29.91 U2.1
  Top 0.191: R15.2 54.93,34.29 54.93,30.48 54.36,29.91 U2.1
F_D
  Top 0.152: U1.33 40.91,27.95 40.91,28.75 42.31,30.14 44.83,30.14 44.85,30.16 44.85,30.56 45.15,30.86 45.15,32.54 46.33,33.72 U2.5
F_HD
  Top 0.152: U1.31 41.61,27.95 41.61,28.59 42.56,29.54 45.09,29.54 45.46,29.91 45.46,30.3 46.33,31.18 U2.7
F_Q
  Top 0.152: U1.28 42.66,27.95 42.66,28.29 42.95,28.58 47.75,28.58 50.34,31.18 U2.2
F_WP
  Top 0.152: U1.29 42.31,27.95 42.31,28.37 42.83,28.89 47.56,28.89 50.38,31.71 52.67,31.71 U2.3
GND  (via drill 0.38)
  Top 0.203: C18.2 46.93,21.27 49.26,18.94 49.26,18.02 49.47,17.82 R50.2
  other vias: 7.75,27.88 7.81,26.16 7.81,24.32 7.81,22.61 7.81,21.08 7.75,19.37 7.62,18.29 10.86,19.49 12.51,18.16 13.27,19.43 14.67,18.29 15.3,19.75 14.92,21.53 14.99,22.99 15.43,24.7 14.99,26.04 12.76,26.92 10.48,26.73 11.3,27.81 14.03,27.81 18.35,19.18 20.19,22.54 20.13,23.81 22.1,24.96 20.26,26.67 6.67,12.06 5.14,13.27 9.97,13.53 16.19,12.38 17.46,12.89 12.26,9.21 13.84,6.41 24.38,14.16 23.05,12.95 23.18,14.03 27.88,11.87 33.02,12.57 26.92,17.08 25.02,19.11 26.23,24.57 25.21,24.64 24.96,26.04 23.81,28.32 9.4,33.46 8.45,34.8 10.48,37.91 8.45,41.27 10.22,41.21 8.76,45.28 17.4,46.86 19.68,46.74 15.18,47.12 10.99,48.77 10.1,51.75 7.11,51.94 5.65,47.69 2.16,50.55 29.21,40.96 34.23,39.31 29.4,38.86 31.81,35.88 31.75,33.91 36.89,37.78 36.83,40.07 41.66,38.99 41.97,42.42 40.89,32.19 45.09,35.12 44.32,31.56 51.5,33.66 52.2,35.56 50.48,35.5 50.16,37.15 51.12,40.26 49.53,39.69 50.29,40.96 51.75,42.86 51.82,44.13 60.01,45.34 58.67,46.55 49.02,45.72 47.88,44.83 45.97,44.96 46.42,42.16 46.55,39.81 47.62,38.16 44.96,42.55 50.99,29.91 36.45,14.61 26.23,43.62 35.31,26.42 42.04,26.42 41.97,19.62 35.24,19.56 35.37,22.92 38.54,22.99 38.61,26.48 41.78,22.99 38.54,19.62
  pour Route2: 0.06,0.13 0,53.34 68.58,53.34 68.58,0
  pour Top: 0,0 0,53.34 68.58,53.34 68.58,0
  pour Bottom: 0,0 0,53.34 68.58,53.34 68.58,0
HOST_5V
  Top 0.305: UBST.6 55.31,16.07 55.31,16
  Top 0.61: CBSTO1.1 53.85,13.59 CBSTO2.1 49.97,13.59 CHSINB.1 | CBSTO1.1 55.18,13.53 CBSTFF.1 RBSTTOP.1 55.31,15.11 55.31,16 | CBSTO1.1 54.17,13.27 CHSIN.1 54.17,11.28 UHSW.1
HOST_ILIM
  Top 0.152: RHSLIM.2 55.88,8.45 55.88,9.97 56.13,10.22 UHSW.5
JUSBCC1
  Top 0.203: JUSB.A5 8.43,39.35 R7.1
JUSBCC2
  Top 0.203: JUSB.B5 9.12,36.35 10.35,35.12 R8.1
LCD_BL  (via drill 0.3)
  Top 0.152: U1.20 47.19,25.33 50.39,28.53 v50.39,29.04 | JDSI.18 37.03,41.86 v37.02,41.85
  Bottom 0.152: v50.39,29.04 50.39,34.44 42.99,41.85 v37.02,41.85
LCD_RST  (via drill 0.3)
  Top 0.152: U1.22 46.81,26.03 47.94,27.15 v47.94,27.34 | v42.44,41.11 42.19,41.36 JDSI.17
  Bottom 0.152: v47.94,27.34 47.94,35.56 42.44,41.06 v42.44,41.11
LED_ON
  Top 0.152: ON.A 61.03,34.04 RON.2
LED_USER
  Top 0.152: L.A 59.69,35.31 RUSER.2
MISO
  Top 0.152: U1.18 47.38,24.62 51.3,28.55 61.44,28.55 ICSP.1
MOSI
  Top 0.152: U1.17 47.46,24.28 51.43,28.25 62.1,28.25 62.91,29.06 64.8,29.06 ICSP.4
NEOPIXEL  (via drill 0.3, 0.33)
  Top 0.152: U1.25 44.63,27.08 v44.79,27.23 | v28.7,40.13 17.59,40.13 13.53,44.2 10.65,44.2 LED1.1
  Bottom 0.152: v44.79,27.23 45.33,27.77 45.33,28.49 44.76,29.05 39.2,29.05 38.99,29.25 34.61,29.25 34.39,29.04 33.44,29.04 28.57,33.9 28.57,40.01 v28.7,40.13
RESET  (via drill 0.33, 0.38)
  Top 0.152: U1.103 42.63,17.82 43.18,17.27 v43.24,17.27
  Top 0.203: C46.1 3.49,49.36 | 3.49,49.36 2.79,49.36 SWRESET.1 | R22.2 3.49,47.12 3.49,49.36
  Top 0.254: C46.1 4.45,50.55 v4.38,50.61
  Bottom 0.152: v43.24,17.27 43.42,17.27 44.24,16.45 50.41,16.45 59.36,25.4 ICSP.5
  Bottom 0.191: ICSP.5 63.37,25.21 63.37,6.79 64.9,5.27 64.9,1.27 64.33,0.7 34.86,0.7 POWER.3
  Bottom 0.254: v4.38,50.61 6.73,52.96 63.75,52.96 65.66,51.05 65.66,40.23 68.07,37.81 68.07,24.13 67.5,23.56 65.02,23.56 63.37,25.21
RX  (via drill 0.3)
  Top 0.152: v44.45,16.95 44.32,16.95 43.1,18.18 U1.104
  Bottom 0.152: v44.45,16.95 44.64,16.76 50.16,16.76 62.23,28.83 62.23,49.66 63.37,50.8 IOL.8
SCK
  Top 0.152: U1.16 43.51,23.9 43.85,23.9 43.87,23.88 47.5,23.88 51.56,27.94 ICSP.3
SCL  (via drill 0.3, 0.38)
  Top 0.152: JDSI.20 JCSI.20 | U1.63 29.91,23.93 v29.71,24.12 | R54.2 29.15,42.86 v27.24,42.86 26.04,42.86 24.45,44.45 24.45,46.35 v24.26,46.55
  Top 0.191: JCSI.20 29.28,42.86 R54.2
  Top 0.203: JQT.4 7.01,49.36 7.59,49.95 12.4,49.95 14.18,48.17 18.14,48.17 18.8,48.83 IOH.1
  Bottom 0.152: v29.71,24.12 29.97,24.38 31.81,24.38 31.88,24.45 31.88,25.72 30.1,27.5 30.1,30.29 27.18,33.21 27.18,42.8 v27.24,42.86 | v24.26,46.55 23.05,46.55 IOH.1
SD2CLK  (via drill 0.3)
  Top 0.152: U6.25 v15.43,29.84 15.43,29.91 R35.2 | U1.65 33.71,23.25 33.37,23.25 33.35,23.27 29.94,23.27 29.65,22.98 29.05,22.98 28.82,23.21 v28.82,24.1
  Bottom 0.152: v28.82,24.1 28.56,24.1 28.56,26.01 23.9,30.67 16.26,30.67 v15.43,29.84
SD2CMD  (via drill 0.3)
  Top 0.152: U6.24 16.48,27.91 R36.2 17.46,28.96 17.46,29.66 v17.59,29.78 | v30.19,22.13 30.4,21.92 31.52,21.92 31.77,22.18 U1.68
  Bottom 0.152: v30.19,22.13 29.43,22.89 29.17,22.89 28.18,23.88 28.18,25.96 23.79,30.36 18.16,30.36 v17.59,29.78
SD2D0  (via drill 0.3)
  Top 0.152: U1.61 31.14,24.62 v30.45,25.32 | U6.26 14.61,29.03 v14.61,29.9 15.11,30.4 R31.2
  Bottom 0.152: v30.45,25.32 30.24,25.53 29.47,25.53 24.03,30.98 15.69,30.98 v14.61,29.9
SD2D1  (via drill 0.3)
  Top 0.152: U1.60 31.51,24.98 v31.15,25.33 | U6.27 13.91,29.09 v13.91,29.91 R32.2
  Bottom 0.152: v31.15,25.33 30.65,25.84 29.6,25.84 24.16,31.28 15.28,31.28 v13.91,29.91
SD2D2  (via drill 0.3)
  Top 0.152: R33.2 13.03,30.53 v13.03,29.86 U6.28 | U1.58 32.01,25.68 31.5,26.18 29.58,26.18 27.3,28.46 v27.3,28.91
  Bottom 0.152: v27.3,28.91 27.3,29 24.72,31.59 14.76,31.59 v13.03,29.86
SD2D3  (via drill 0.3)
  Top 0.152: U1.57 32.09,26.03 31.63,26.48 29.71,26.48 28.04,28.15 v28.04,28.77 | U6.29 12.23,29.87 v12.19,29.91 R34.2
  Bottom 0.152: v28.04,28.77 28.16,28.89 28.16,29.02 25.29,31.89 14.17,31.89 v12.19,29.91
SD_CD  (via drill 0.3)
  Top 0.152: U1.87 37.03,17.41 37.03,15.24 v37.09,15.18 | JSD.CD 20.36,17.83 20.18,17.66 19.75,17.66 v19.43,17.34 RSDCD.2
  Top 0.305: RSDCD.2
  Bottom 0.152: v37.09,15.18 37.01,15.1 37.01,14.36 36.7,14.04 27.25,14.04 23.95,17.34 v19.43,17.34
SD_CLK  (via drill 0.3)
  Top 0.152: U1.84 35.98,17.51 35.56,17.09 v35.56,16.81 | v22.23,23.94 22.27,23.98 JSD.5
  Bottom 0.152: v35.56,16.81 34.88,16.12 33.3,16.12 33.02,16.4 29.4,16.4 22.23,23.57 v22.23,23.94
SD_CMD  (via drill 0.3)
  Top 0.152: U1.86 36.68,16.24 v36.39,15.94 | JSD.3 22.22,21.78 v22.1,21.91 18.73,21.91 RSDCMD.2
  Bottom 0.152: v22.1,21.91 22.1,21.35 22.91,20.54 22.91,19.86 27.29,15.47 35.92,15.47 v36.39,15.94
SD_D0  (via drill 0.3)
  Top 0.152: U1.80 34.56,18.15 34.56,17.81 34.14,17.4 v33.91,17.4 | JSD.7 23.64,26.23 v22.16,26.23 20.51,24.57 RSD0.2
  Bottom 0.152: v33.91,17.4 28.89,17.4 22.73,23.56 22.73,25.65 v22.16,26.23
SD_D1  (via drill 0.3)
  Top 0.152: U1.81 34.93,17.76 34.41,17.24 34.41,17.16 34.14,16.88 v34.14,16.63 | JSD.8 23.36,26.97 21.95,26.97 21.72,26.74 v21.59,26.74 20.51,25.65 RSD1.2
  Bottom 0.152: v34.14,16.63 34.14,16.88 34.41,17.16 34.41,17.73 34.18,17.97 28.88,17.97 23.18,23.67 23.18,26.04 22.48,26.74 v21.59,26.74
SD_D2  (via drill 0.3)
  Top 0.152: U1.82 35.28,17.68 34.72,17.11 34.72,16.46 33.94,15.69 v33.94,14.61 | JSD.1 23.64,19.62 v22.1,19.62 19.05,19.62 RSD2.2
  Bottom 0.152: v33.94,14.61 33.69,14.85 26.87,14.85 v22.1,19.62
SD_D3  (via drill 0.3)
  Top 0.152: U1.83 35.61,18.15 35.61,17.57 35.05,17.02 35.05,16.32 34.6,15.87 v34.6,14.92 | JSD.2 23.66,20.7 v22.04,20.7 18.99,20.7 RSD3.2
  Bottom 0.152: v22.04,20.7 22.04,20.4 22.6,19.83 22.6,19.55 26.98,15.17 34.22,15.17 34.47,14.92 v34.6,14.92
SDA  (via drill 0.3)
  Top 0.152: JDSI.21 v36.26,43.36 | v36.26,43.36 JCSI.21 | U1.64 29.46,23.58 v29.37,23.48 | v36.26,43.36
  Top 0.191: R53.2 42.37,43.36 JDSI.21
  Top 0.203: JQT.3 8.01,49.35 8.26,49.59 12.26,49.59 14.03,47.82 20.64,47.82 | 20.64,47.82 21.34,48.51 IOH.2 | 20.64,47.82 26.48,47.82 29.84,44.45 31.78,44.45 JCSI.21
  Bottom 0.152: v29.37,23.48 30.84,23.48 31.43,24.07 31.93,24.07 32.18,24.32 32.18,25.91 30.4,27.68 30.4,30.42 27.48,33.34 27.48,42.28 28.51,43.31 36.2,43.31 v36.26,43.36
SYS_EN  (via drill 0.3)
  Top 0.152: v21.34,4.51 22.25,4.51 SWPWR.B
  Top 0.254: U4.1 33.72,9.75 REN.2 34.38,7.78 v34.38,7.75
  Bottom 0.152: v34.38,7.75 33.94,8.19 24.45,8.19 21.34,5.08 v21.34,4.51
TX  (via drill 0.3)
  Top 0.152: U1.1 43.48,18.29 44.31,17.46 v45.07,17.46
  Bottom 0.152: v45.07,17.46 45.46,17.07 50.04,17.07 61.92,28.95 61.92,49.84 IOL.7
U0RX  (via drill 0.3)
  Top 0.152: U1.70 31.94,21.48 31.77,21.31 29.29,21.31 28.67,21.92 v28.59,21.92 | v21.01,29.78 20.98,29.78 20.52,30.23 20.52,32.63 JUART0.2
  Bottom 0.152: v28.59,21.92 28.59,22.55 27.57,23.57 27.57,25.7 23.91,29.36 22.71,29.36 22.62,29.28 22.14,29.28 21.65,29.78 v21.01,29.78
U0TX  (via drill 0.3)
  Top 0.152: U1.69 31.86,21.83 31.64,21.61 29.7,21.61 v29.4,21.91 | JUART0.1 22.35,33.34 v22.35,29.79
  Bottom 0.152: v29.4,21.91 29.4,22.2 27.88,23.72 27.88,25.83 24.04,29.67 22.47,29.67 v22.35,29.79
U4_FB
  Top 0.254: U4.5 31.56,9.31 R4.1 31.62,8.38 R3.2
U4_SW
  Top 0.61: U4.3 34.8,11.68 35.55,10.93 L2.P$1
U5_SW
  Top 0.61: U5.3 48.59,11.87 L3.P$1
USBH_EN  (via drill 0.3, 0.33)
  Top 0.152: U1.15 47.63,23.58 48.03,23.97 48.97,23.97 49.59,23.35 49.59,18.16 51.16,16.59 v51.61,16.59 | UHSW.3 55.18,9.27 v55.31,9.4
  Top 0.191: R50.1 51.05,16.7 51.16,16.59
  Bottom 0.152: v51.61,16.59 55.31,12.89 v55.31,9.4
USBHS_M  (via drill 0.33)
  Top 0.152: U1.49 35.28,28.93 34.36,29.86 v34.05,29.86 | v51.75,25.53 51.75,25.78 52.45,26.48 56.2,26.48 56.66,26.01 56.66,25.34 | JHS.D- 58.53,15.76 56.66,17.63 56.66,25.34 | D3.K 56.46,25.34 56.66,25.34
  Bottom 0.152: v34.05,29.86 39.25,29.86 39.45,29.66 45.08,29.66 45.97,28.77 45.97,26.08 46.78,25.27 50.35,25.27 50.67,25.59 51.69,25.59 v51.75,25.53
USBHS_P  (via drill 0.33)
  Top 0.152: v33.31,29.9 33.31,29.86 33.84,29.34 34.45,29.34 34.93,28.85 U1.50 | v50.99,25.04 51.18,25.23 51.18,25.73 52.26,26.81 56.39,26.81 56.49,26.71 | 56.49,26.71 56.97,26.23 56.97,19.49 JHS.D+ | D4.K 56.52,26.73 56.49,26.71
  Bottom 0.152: v33.31,29.9 33.53,29.68 33.53,29.64 33.84,29.34 34.27,29.34 34.48,29.56 39.12,29.56 39.32,29.36 44.89,29.36 45.63,28.61 45.63,25.95 46.66,24.92 50.93,24.92 50.93,24.98 v50.99,25.04
USBJD_M  (via drill 0.3, 0.33)
  Top 0.152: U1.52 33.22,27.93 32.9,28.24 31.13,28.24 31.06,28.31 31.06,29.35 30.64,29.77 29.57,29.77 29.48,29.86 29.48,30.14 29.19,30.44 28.96,30.44 v28.74,30.65 | v13.46,40.07 R9.2
  Bottom 0.152: v28.74,30.65 23.15,36.25 14.94,36.25 13.46,37.72 v13.46,40.07
USBJD_M_C
  Top 0.203: JUSB.A7 6.47,37.85 6.41,37.91 6.41,38.61 6.66,38.85 JUSB.B7 9.32,38.85 U10.1 10.54,38.92 | R9.1 10.6,38.99 10.54,38.92 | 10.54,38.92 U10.6
USBJD_P  (via drill 0.3)
  Top 0.152: v16.26,34.67 13.27,34.67 12,35.94 R10.2 | v28.98,29.93 29.45,29.46 30.51,29.46 30.75,29.22 30.75,28.11 30.99,27.88 32.71,27.88 33.17,27.43 U1.53
  Bottom 0.152: v28.98,29.93 28.73,29.93 23.73,34.92 16.51,34.92 v16.26,34.67
USBJD_P_C
  Top 0.203: JUSB.B6 8.19,37.35 | 8.19,37.35 9.06,37.35 U10.3 10.6,37.02 | JUSB.A6 8.01,38.35 8.19,38.16 8.19,37.35 | 10.6,37.02 U10.4 | R10.1 10.6,37.02
VBAT
  Top 0.61: UBAT.3 53.91,43.75 54.8,42.87 CBAT.1
  Top 1.016: JBAT.2 55.99,42.05 CBAT.1 RBTOP.1 52.53,40.64 QBAT.3
VBUS  (via drill 0.33)
  Top 0.254: JUSB.B4A9 6.84,35.7 6.48,36.07 5.91,36.07 | 6.22,40.13 6.48,40.13 6.84,40.5 JUSB.A4B9
  Top 0.406: 5.65,40.01 5.78,40.13 6.22,40.13
  Top 0.61: C10.1 13.53,37.82 D2.A | 5.91,36.07 5.59,36.39 v5.59,39.5 5.59,39.94 5.65,40.01 | v11.18,41.15 13.91,41.15 14.61,40.45 14.61,39.78 13.31,38.48 C10.1 | C10.1 13.25,37.97 U10.5
  Bottom 0.61: v5.59,39.5 9.97,39.5 11.18,40.7 v11.18,41.15
VBUS_HS
  Top 0.61: UHSW.6 56.92,11.53 56.95,11.5 | 56.95,11.5 JHS.VBUS | 56.95,11.5 57.54,10.91 57.54,9.72 57.98,9.28 C11.1 59.22,8.53 C51.1
VCC  (via drill 0.38)
  Top 0.254: REN.1 32.26,8.89 32.26,10.51 U4.4
  Top 0.305: UBST.3 55.88,18.41
  Top 0.61: 55.88,18.41 55.18,19.11 55.18,21.27 LBST.1
  Top 1.016: DBAT.C 28.78,8.71 29.08,9.02 C5.1 30.39,10.99 U4.4 31.11,11.71 v31.11,12.7 | QBAT.2 53.34,36.89 CVSYS.1 53.66,36.45 54.74,36.45 56.26,34.92 v56.26,34.73 | CBSTIN.1 55.18,25.15 55.18,21.27 | 55.18,19.11 54.61,19.11 v54.55,19.18
  Route15 1.016: POWER.5 38.04,2.6 38.04,5.59 | 38.04,5.59 38.04,6.1 38.99,7.05 43.41,7.05 52.56,16.2 52.56,17.19 v54.55,19.18 54.55,33.02 v56.26,34.73 56.84,34.73 57.14,34.43 62.91,34.43 65.91,31.43 ICSP.2 | v31.11,12.7 31.11,12.51 38.04,5.59
VDDO4
  Top 0.191: U1.74 32.45,20.08 32.33,19.95 30.86,19.95 30.61,19.7 C43.1
VFLASH  (via drill 0.33)
  Top 0.191: 49.47,34.86 R15.1 | U1.30 41.94,28.46 42.69,29.21 46.09,29.21 U2.8 47.75,29.91 v48.93,31.08 49.34,31.5 49.34,34.73 C35.1 49.47,34.86 | C36.1 49.09,35.12 49.34,34.86 49.47,34.86 | U1.71 32.04,21.12 31.9,20.98 28.38,20.98 v28.19,20.8 28.1,20.7 26.64,20.7 26.1,21.25 C34.1
  Route15 0.305: v28.19,20.8 31.01,20.8 36.88,26.67 36.88,31.49 36.55,31.82 36.55,32.55 36.94,32.94 47.07,32.94 v48.93,31.08
VIN
  Top 1.016: JDC.PWR 10.18,7.29 11.75,5.71 D1.A
VIN_PROT
  Top 0.254: U3.3 13.21,11.74 14.16,10.79 U3.5
  Top 0.61: U3.5 14.16,8.76 14.92,8 C2.1
  Top 1.016: C2.1 14.92,5.97 D1.C 15.24,5.78 43.88,5.78 45.72,3.94 POWER.8
VPSRAM  (via drill 0.33)
  Top 0.191: C30.1 27.24,26.89 C31.1 28.73,26.35 29.22,25.86 31.37,25.86 31.9,25.33 U1.59 34.3,25.33 34.42,25.21 34.42,22.8 34.15,22.53 U1.67 | U1.67 | U1.67 31.67,22.53 31.38,22.24 30.95,22.24 30.53,22.65 27.76,22.65 C33.1 27.3,22.2 v27.3,21.33 | U1.72 32.21,20.78 32.2,20.77 32.17,20.77 32.04,20.64 28.9,20.64 28.32,20.06
  Top 0.203: C29.1 27.2,19.9 C32.1 v28.19,20.07 v28.19,20.06 28.32,20.06
  Bottom 0.191: v27.3,21.33 27.56,21.08 27.56,20.63 28.13,20.06 v28.19,20.06
XTALN
  Top 0.152: C45.1 40.28,11.98 Y1.3 40.54,12.9 40.98,13.34 40.98,14.48 42.16,14.48 42.23,14.54 42.23,16.08 41.48,16.83 41.48,17.3 41.23,17.54 U1.99
XTALP
  Top 0.152: Y1.1 42.67,13.9 C44.1 42.55,13.97 42.55,16.32 41.86,17 41.86,17.34 41.58,17.62 U1.100
(copper drawn outside any net)
  shapes: Route10 area x1, Route11 area x1, Route12 area x1, Route13 area x1, Route14 area x1, Route15 area x1, Route2 area x1, Route3 area x1, Route4 area x1, Route5 area x1, Route6 area x1, Route7 area x1, Route8 area x1, Route9 area x1

## Text on the board
Pinguin_tBackup: Reset | I2C QT | SCL | SDA | 13 | 12 | 11 | 10 | 9 | 8 | 7 | 6 | 5 | 4 | 3 | 2 | 1 | 0 | 3V3 | GND | 22 | BOOT | 22 | Neo | ESP32-P4 / Metro | CAMERA | DISPLAY | DONE | CHG | Dev Edition / P4 v1 Chip | L | RX | TX | ON | SPI | UART0 | 1 | 1 | ESP32-C6 | VCC | MIS | 16MB QSPI | CLK | MO | RST | GND | USB Host | MicroSD | POWER | NC | 3V3 | RST | 3V3 | VCC | GND | GND | VIN | A0 | A1 | A2 | A3 | A4 | A5 | ON | OFF | DC in 7~12V